# Altium schematic sheet RK3566_DDR-PHY_SHEET.SchDoc
size 420 x 297 mm; SheetNumber: 9; SheetTotal: 23
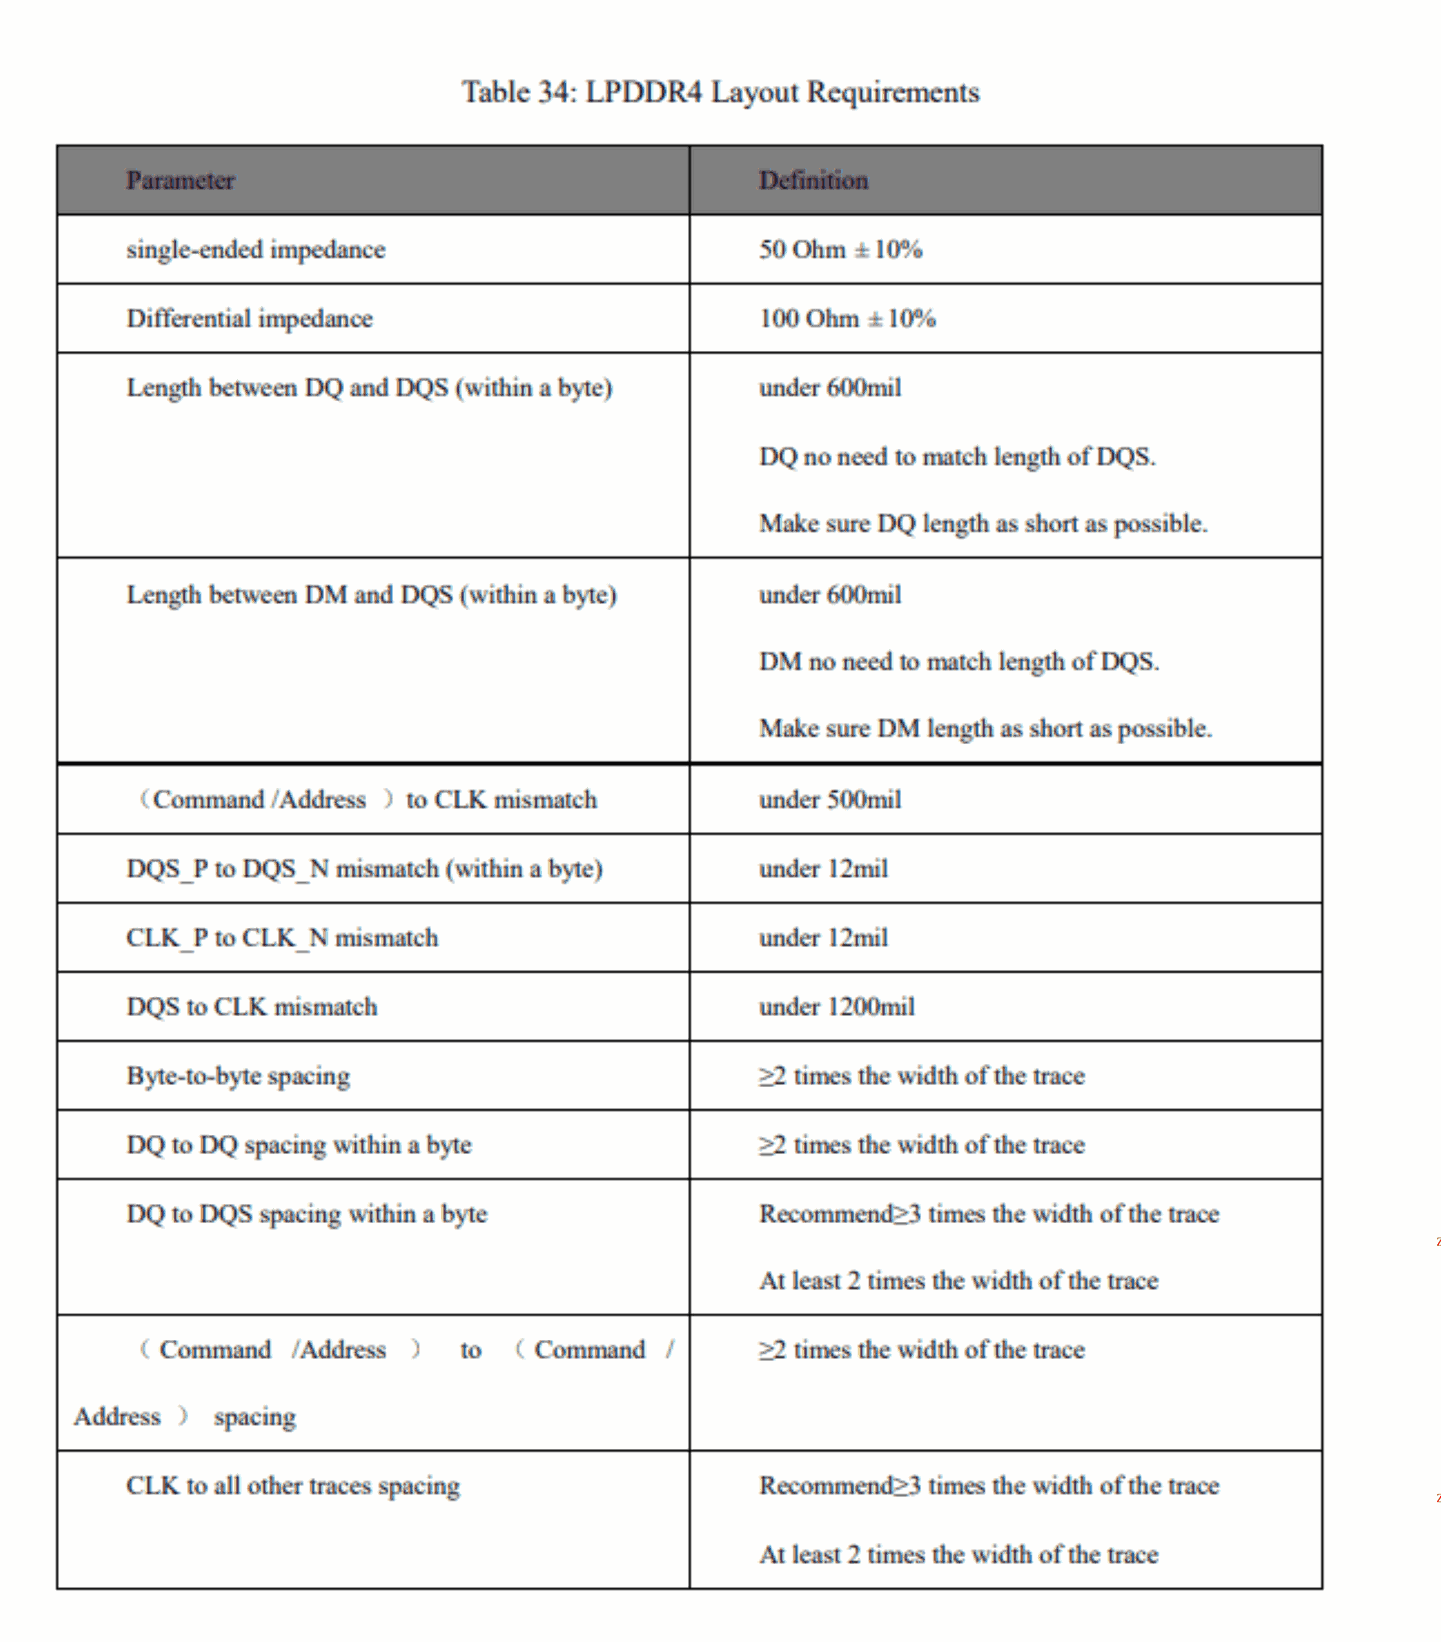
[diagram p0: RK3566_DDR-PHY_SHEET.SchDoc, left]
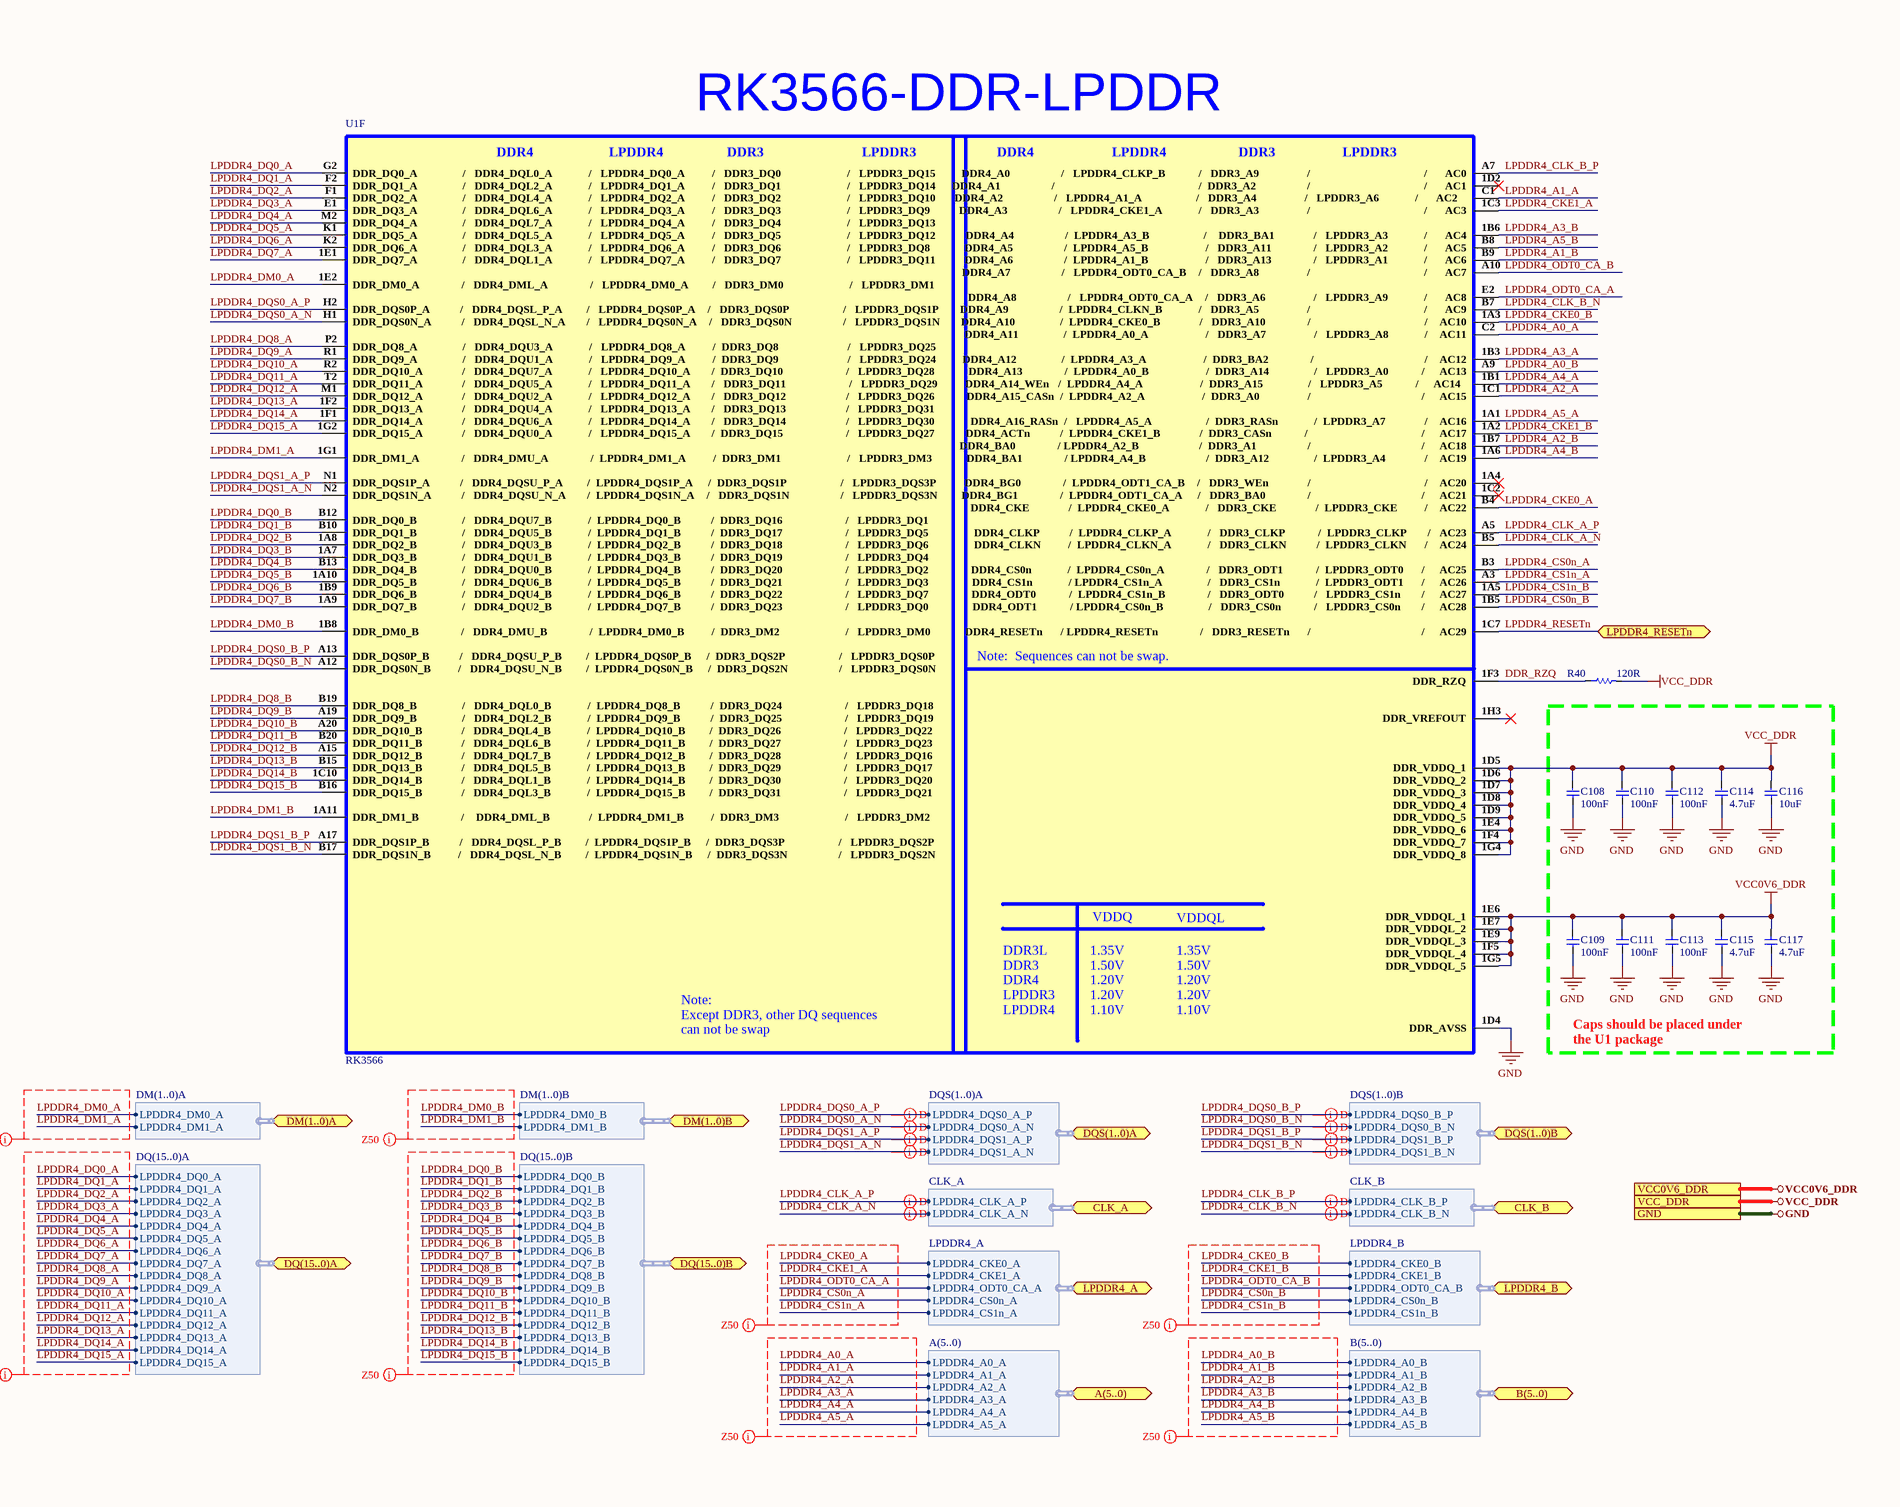
[diagram p1: RK3566_DDR-PHY_SHEET.SchDoc, right]

## Parts
C108  100nF  [CAP-0201]
C109  100nF  [CAP-0201]
C110  100nF  [CAP-0201]
C111  100nF  [CAP-0201]
C112  100nF  [CAP-0201]
C113  100nF  [CAP-0201]
C114  4.7uF  [Cap-0402]
C115  4.7uF  [Cap-0402]
C116  10uF  [Cap-0603]
C117  4.7uF  [Cap-0402]
R40  120R  [Res-0402]
U1  RK3566  [BGA-565(15.5x14.4)]  (part F of 22)

## Ports
A(5..0) (bidir, harness A(5..0), see DRAM_LPDDR4_SHEET[6B]), B(5..0) (bidir, harness B(5..0), see DRAM_LPDDR4_SHEET[6B]), CLK_A (bidir, harness CLK_A, see DRAM_LPDDR4_SHEET[5D]), CLK_B (bidir, harness CLK_B, see DRAM_LPDDR4_SHEET[5D]), DM(1..0)A (bidir, harness DM(1..0)A, see DRAM_LPDDR4_SHEET[6C]), DM(1..0)B (bidir, harness DM(1..0)B, see DRAM_LPDDR4_SHEET[6C]), DQ(15..0)A (bidir, harness DQ(15..0)A, see DRAM_LPDDR4_SHEET[6A]), DQ(15..0)B (bidir, harness DQ(15..0)B, see DRAM_LPDDR4_SHEET[6B]), DQS(1..0)A (bidir, harness DQS(1..0)A, see DRAM_LPDDR4_SHEET[5D]), DQS(1..0)B (bidir, harness DQS(1..0)B, see DRAM_LPDDR4_SHEET[5D]), GND (see DRAM_LPDDR4_SHEET[6D], eMMC_SPI-FLASH_SHEET[1D], HDMI2.0_SHEET[3D], POWER_LDO_SHEET[3D], POWER_OTHER_SHEET[3C], POWER_PMIC_RK809_CODEC[3C], POWER_PMIC_RK809_DC DC[3D], POWER_PMIC_RK809_LDO[4C], POWER_PMIC_RK809_MGM[3D], RK3566_AUDIO_SHEET[3C], RK3566_FLASH-SD_SHEET[4C], RK3566_OSC_PMUIO_SHEET[5D], RK3566_POWER_SHEET[3D], RK3566_SARADC_GPIO[3D], RK3566_USB_PCIe_SHEET[3D], RK3566_VI_SHEET[3D], RK3566_VO_SHEET_1[3C], RK3566_VO_SHEET_2[4C], TYPE-C_INTERFACE_SHEET[3D], TYPE-C_TO_MIPI-CSI_SHEET[5D], USB2.0_SHEET[3D], WIFI-6_SHEET[3D]), LPDDR4_A (bidir, harness LPDDR4_A, see DRAM_LPDDR4_SHEET[6C]), LPDDR4_B (bidir, harness LPDDR4_B, see DRAM_LPDDR4_SHEET[6C]), LPDDR4_RESETn (bidir, see DRAM_LPDDR4_SHEET[4C]), VCC0V6_DDR (see DRAM_LPDDR4_SHEET[6D]), VCC_DDR (see DRAM_LPDDR4_SHEET[6D], POWER_PMIC_RK809_DC DC[3D])

## Harnesses
DQ(15..0)A: LPDDR4_DQ0_A, LPDDR4_DQ1_A, LPDDR4_DQ2_A, LPDDR4_DQ3_A, LPDDR4_DQ4_A, LPDDR4_DQ5_A, LPDDR4_DQ6_A, LPDDR4_DQ7_A, LPDDR4_DQ8_A, LPDDR4_DQ9_A, LPDDR4_DQ10_A, LPDDR4_DQ11_A, LPDDR4_DQ12_A, LPDDR4_DQ13_A, LPDDR4_DQ14_A, LPDDR4_DQ15_A
DQ(15..0)B: LPDDR4_DQ0_B, LPDDR4_DQ1_B, LPDDR4_DQ2_B, LPDDR4_DQ3_B, LPDDR4_DQ4_B, LPDDR4_DQ5_B, LPDDR4_DQ6_B, LPDDR4_DQ7_B, LPDDR4_DQ8_B, LPDDR4_DQ9_B, LPDDR4_DQ10_B, LPDDR4_DQ11_B, LPDDR4_DQ12_B, LPDDR4_DQ13_B, LPDDR4_DQ14_B, LPDDR4_DQ15_B
DM(1..0)A: LPDDR4_DM0_A, LPDDR4_DM1_A
DM(1..0)B: LPDDR4_DM0_B, LPDDR4_DM1_B
DQS(1..0)A: LPDDR4_DQS0_A_P, LPDDR4_DQS0_A_N, LPDDR4_DQS1_A_P, LPDDR4_DQS1_A_N
DQS(1..0)B: LPDDR4_DQS0_B_P, LPDDR4_DQS0_B_N, LPDDR4_DQS1_B_P, LPDDR4_DQS1_B_N
CLK_B: LPDDR4_CLK_B_P, LPDDR4_CLK_B_N
CLK_A: LPDDR4_CLK_A_P, LPDDR4_CLK_A_N
A(5..0): LPDDR4_A3_A, LPDDR4_A5_A, LPDDR4_A1_A, LPDDR4_A0_A, LPDDR4_A2_A, LPDDR4_A4_A
B(5..0): LPDDR4_A3_B, LPDDR4_A5_B, LPDDR4_A1_B, LPDDR4_A0_B, LPDDR4_A2_B, LPDDR4_A4_B
LPDDR4_A: LPDDR4_CKE1_A, LPDDR4_ODT0_CA_A, LPDDR4_CKE0_A, LPDDR4_CS0n_A, LPDDR4_CS1n_A
LPDDR4_B: LPDDR4_ODT0_CA_B, LPDDR4_CKE0_B, LPDDR4_CKE1_B, LPDDR4_CS1n_B, LPDDR4_CS0n_B

## Nets
GND: C108.1 C109.1 C110.1 C111.1 C112.1 C113.1 C114.1 C115.1 C116.1 C117.1 U1.1D4(DDR_AVSS) ; port GND
VCC0V6_DDR: C109.2 C111.2 C113.2 C115.2 C117.2 U1.1E6(DDR_VDDQL_1) U1.1E7(DDR_VDDQL_2) U1.1E9(DDR_VDDQL_3) U1.1F5(DDR_VDDQL_4) U1.1G5(DDR_VDDQL_5) ; port VCC0V6_DDR
VCC_DDR: C108.2 C110.2 C112.2 C114.2 C116.2 R40.2 U1.1D5(DDR_VDDQ_1) U1.1D6(DDR_VDDQ_2) U1.1D7(DDR_VDDQ_3) U1.1D8(DDR_VDDQ_4) U1.1D9(DDR_VDDQ_5) U1.1E4(DDR_VDDQ_6) U1.1F4(DDR_VDDQ_7) U1.1G4(DDR_VDDQ_8) ; port VCC_DDR
DDR_RZQ: R40.1 U1.1F3(DDR_RZQ)
LPDDR4_A0_A: U1.C2(DDR4_A11_______________/__LPDDR4_A0_A___________________/___DDR3_A7________________/___LPDDR3_A8____________/____AC11) ; port A(5..0).LPDDR4_A0_A
LPDDR4_A0_B: U1.A9(DDR4_A13______________/__LPDDR4_A0_B___________________/__DDR3_A14_______________/___LPDDR3_A0___________/_____AC13) ; port B(5..0).LPDDR4_A0_B
LPDDR4_A1_A: U1.C1(DDR4_A2_________________/___LPDDR4_A1_A__________________/___DDR3_A4________________/___LPDDR3_A6____________/______AC2) ; port A(5..0).LPDDR4_A1_A
LPDDR4_A1_B: U1.B9(DDR4_A6_________________/__LPDDR4_A1_B___________________/___DDR3_A13______________/___LPDDR3_A1____________/______AC6) ; port B(5..0).LPDDR4_A1_B
LPDDR4_A2_A: U1.1C1(DDR4_A15_CASn__/__LPDDR4_A2_A___________________/__DDR3_A0________________/_____________________________________/_____AC15) ; port A(5..0).LPDDR4_A2_A
LPDDR4_A2_B: U1.1B7(DDR4_BA0______________/_LPDDR4_A2_B____________________/__DDR3_A1_________________/_____________________________________/_____AC18) ; port B(5..0).LPDDR4_A2_B
LPDDR4_A3_A: U1.1B3(DDR4_A12_______________/__LPDDR4_A3_A___________________/__DDR3_BA2______________/_____________________________________/____AC12) ; port A(5..0).LPDDR4_A3_A
LPDDR4_A3_B: U1.1B6(DDR4_A4_________________/__LPDDR4_A3_B__________________/____DDR3_BA1_____________/___LPDDR3_A3____________/______AC4) ; port B(5..0).LPDDR4_A3_B
LPDDR4_A4_A: U1.1B1(DDR4_A14_WEn___/__LPDDR4_A4_A___________________/__DDR3_A15_______________/___LPDDR3_A5___________/_____AC14) ; port A(5..0).LPDDR4_A4_A
LPDDR4_A4_B: U1.1A6(DDR4_BA1______________/_LPDDR4_A4_B____________________/__DDR3_A12_______________/__LPDDR3_A4_____________/____AC19) ; port B(5..0).LPDDR4_A4_B
LPDDR4_A5_A: U1.1A1(DDR4_A16_RASn__/___LPDDR4_A5_A__________________/__DDR3_RASn____________/__LPDDR3_A7_____________/____AC16) ; port A(5..0).LPDDR4_A5_A
LPDDR4_A5_B: U1.B8(DDR4_A5_________________/__LPDDR4_A5_B___________________/___DDR3_A11______________/___LPDDR3_A2____________/______AC5) ; port B(5..0).LPDDR4_A5_B
LPDDR4_CKE0_A: U1.B4(DDR4_CKE_____________/__LPDDR4_CKE0_A____________/___DDR3_CKE_____________/__LPDDR3_CKE_________/____AC22) ; port LPDDR4_A.LPDDR4_CKE0_A
LPDDR4_CKE0_B: U1.1A3(DDR4_A10_______________/__LPDDR4_CKE0_B_____________/___DDR3_A10______________/______________________________________/____AC10) ; port LPDDR4_B.LPDDR4_CKE0_B
LPDDR4_CKE1_A: U1.1C3(DDR4_A3_________________/___LPDDR4_CKE1_A____________/___DDR3_A3________________/______________________________________/______AC3) ; port LPDDR4_A.LPDDR4_CKE1_A
LPDDR4_CKE1_B: U1.1A2(DDR4_ACTn__________/__LPDDR4_CKE1_B_____________/__DDR3_CASn___________/______________________________________/_____AC17) ; port LPDDR4_B.LPDDR4_CKE1_B
LPDDR4_CLK_A_N: U1.B5(DDR4_CLKN_________/__LPDDR4_CLKN_A____________/___DDR3_CLKN__________/__LPDDR3_CLKN______/____AC24) ; port CLK_A.LPDDR4_CLK_A_N
LPDDR4_CLK_A_P: U1.A5(DDR4_CLKP__________/__LPDDR4_CLKP_A____________/___DDR3_CLKP___________/__LPDDR3_CLKP_______/___AC23) ; port CLK_A.LPDDR4_CLK_A_P
LPDDR4_CLK_B_N: U1.B7(DDR4_A9_________________/__LPDDR4_CLKN_B____________/___DDR3_A5________________/______________________________________/______AC9) ; port CLK_B.LPDDR4_CLK_B_N
LPDDR4_CLK_B_P: U1.A7(DDR4_A0_________________/___LPDDR4_CLKP_B___________/___DDR3_A9________________/______________________________________/______AC0) ; port CLK_B.LPDDR4_CLK_B_P
LPDDR4_CS0n_A: U1.B3(DDR4_CS0n____________/__LPDDR4_CS0n_A______________/___DDR3_ODT1___________/__LPDDR3_ODT0______/_____AC25) ; port LPDDR4_A.LPDDR4_CS0n_A
LPDDR4_CS0n_B: U1.1B5(DDR4_ODT1___________/_LPDDR4_CS0n_B_______________/___DDR3_CS0n___________/___LPDDR3_CS0n_______/_____AC28) ; port LPDDR4_B.LPDDR4_CS0n_B
LPDDR4_CS1n_A: U1.A3(DDR4_CS1n____________/_LPDDR4_CS1n_A_______________/___DDR3_CS1n____________/__LPDDR3_ODT1______/_____AC26) ; port LPDDR4_A.LPDDR4_CS1n_A
LPDDR4_CS1n_B: U1.1A5(DDR4_ODT0___________/__LPDDR4_CS1n_B______________/___DDR3_ODT0__________/___LPDDR3_CS1n_______/_____AC27) ; port LPDDR4_B.LPDDR4_CS1n_B
LPDDR4_DM0_A: U1.1E2(DDR_DM0_A______________/___DDR4_DML_A______________/___LPDDR4_DM0_A________/___DDR3_DM0______________________/___LPDDR3_DM1) ; port DM(1..0)A.LPDDR4_DM0_A
LPDDR4_DM0_B: U1.1B8(DDR_DM0_B______________/___DDR4_DMU_B______________/__LPDDR4_DM0_B_________/__DDR3_DM2______________________/___LPDDR3_DM0) ; port DM(1..0)B.LPDDR4_DM0_B
LPDDR4_DM1_A: U1.1G1(DDR_DM1_A______________/___DDR4_DMU_A______________/__LPDDR4_DM1_A_________/__DDR3_DM1______________________/___LPDDR3_DM3) ; port DM(1..0)A.LPDDR4_DM1_A
LPDDR4_DM1_B: U1.1A11(DDR_DM1_B______________/____DDR4_DML_B_____________/__LPDDR4_DM1_B_________/__DDR3_DM3______________________/___LPDDR3_DM2) ; port DM(1..0)B.LPDDR4_DM1_B
LPDDR4_DQ0_A: U1.G2(DDR_DQ0_A_______________/___DDR4_DQL0_A____________/___LPDDR4_DQ0_A_________/___DDR3_DQ0______________________/___LPDDR3_DQ15) ; port DQ(15..0)A.LPDDR4_DQ0_A
LPDDR4_DQ0_B: U1.B12(DDR_DQ0_B_______________/___DDR4_DQU7_B____________/__LPDDR4_DQ0_B__________/__DDR3_DQ16_____________________/___LPDDR3_DQ1) ; port DQ(15..0)B.LPDDR4_DQ0_B
LPDDR4_DQ1_A: U1.F2(DDR_DQ1_A_______________/___DDR4_DQL2_A____________/___LPDDR4_DQ1_A_________/___DDR3_DQ1______________________/___LPDDR3_DQ14) ; port DQ(15..0)A.LPDDR4_DQ1_A
LPDDR4_DQ1_B: U1.B10(DDR_DQ1_B_______________/___DDR4_DQU5_B____________/__LPDDR4_DQ1_B__________/__DDR3_DQ17_____________________/___LPDDR3_DQ5) ; port DQ(15..0)B.LPDDR4_DQ1_B
LPDDR4_DQ2_A: U1.F1(DDR_DQ2_A_______________/___DDR4_DQL4_A____________/___LPDDR4_DQ2_A_________/___DDR3_DQ2______________________/___LPDDR3_DQ10) ; port DQ(15..0)A.LPDDR4_DQ2_A
LPDDR4_DQ2_B: U1.1A8(DDR_DQ2_B_______________/___DDR4_DQU3_B____________/__LPDDR4_DQ2_B__________/__DDR3_DQ18_____________________/___LPDDR3_DQ6) ; port DQ(15..0)B.LPDDR4_DQ2_B
LPDDR4_DQ3_A: U1.E1(DDR_DQ3_A_______________/___DDR4_DQL6_A____________/___LPDDR4_DQ3_A_________/___DDR3_DQ3______________________/___LPDDR3_DQ9) ; port DQ(15..0)A.LPDDR4_DQ3_A
LPDDR4_DQ3_B: U1.1A7(DDR_DQ3_B_______________/___DDR4_DQU1_B____________/__LPDDR4_DQ3_B__________/__DDR3_DQ19_____________________/___LPDDR3_DQ4) ; port DQ(15..0)B.LPDDR4_DQ3_B
LPDDR4_DQ4_A: U1.M2(DDR_DQ4_A_______________/___DDR4_DQL7_A____________/___LPDDR4_DQ4_A_________/___DDR3_DQ4______________________/___LPDDR3_DQ13) ; port DQ(15..0)A.LPDDR4_DQ4_A
LPDDR4_DQ4_B: U1.B13(DDR_DQ4_B_______________/___DDR4_DQU0_B____________/__LPDDR4_DQ4_B__________/__DDR3_DQ20_____________________/___LPDDR3_DQ2) ; port DQ(15..0)B.LPDDR4_DQ4_B
LPDDR4_DQ5_A: U1.K1(DDR_DQ5_A_______________/___DDR4_DQL5_A____________/___LPDDR4_DQ5_A_________/___DDR3_DQ5______________________/___LPDDR3_DQ12) ; port DQ(15..0)A.LPDDR4_DQ5_A
LPDDR4_DQ5_B: U1.1A10(DDR_DQ5_B_______________/___DDR4_DQU6_B____________/__LPDDR4_DQ5_B__________/__DDR3_DQ21_____________________/___LPDDR3_DQ3) ; port DQ(15..0)B.LPDDR4_DQ5_B
LPDDR4_DQ6_A: U1.K2(DDR_DQ6_A_______________/___DDR4_DQL3_A____________/___LPDDR4_DQ6_A_________/___DDR3_DQ6______________________/___LPDDR3_DQ8) ; port DQ(15..0)A.LPDDR4_DQ6_A
LPDDR4_DQ6_B: U1.1B9(DDR_DQ6_B_______________/___DDR4_DQU4_B____________/__LPDDR4_DQ6_B__________/__DDR3_DQ22_____________________/___LPDDR3_DQ7) ; port DQ(15..0)B.LPDDR4_DQ6_B
LPDDR4_DQ7_A: U1.1E1(DDR_DQ7_A_______________/___DDR4_DQL1_A____________/___LPDDR4_DQ7_A_________/___DDR3_DQ7______________________/___LPDDR3_DQ11) ; port DQ(15..0)A.LPDDR4_DQ7_A
LPDDR4_DQ7_B: U1.1A9(DDR_DQ7_B_______________/___DDR4_DQU2_B____________/__LPDDR4_DQ7_B__________/__DDR3_DQ23_____________________/___LPDDR3_DQ0) ; port DQ(15..0)B.LPDDR4_DQ7_B
LPDDR4_DQ8_A: U1.P2(DDR_DQ8_A_______________/___DDR4_DQU3_A____________/___LPDDR4_DQ8_A_________/__DDR3_DQ8_______________________/___LPDDR3_DQ25) ; port DQ(15..0)A.LPDDR4_DQ8_A
LPDDR4_DQ8_B: U1.B19(DDR_DQ8_B_______________/___DDR4_DQL0_B____________/__LPDDR4_DQ8_B__________/__DDR3_DQ24_____________________/___LPDDR3_DQ18) ; port DQ(15..0)B.LPDDR4_DQ8_B
LPDDR4_DQ9_A: U1.R1(DDR_DQ9_A_______________/___DDR4_DQU1_A____________/___LPDDR4_DQ9_A_________/__DDR3_DQ9_______________________/___LPDDR3_DQ24) ; port DQ(15..0)A.LPDDR4_DQ9_A
LPDDR4_DQ9_B: U1.A19(DDR_DQ9_B_______________/___DDR4_DQL2_B____________/__LPDDR4_DQ9_B__________/__DDR3_DQ25_____________________/___LPDDR3_DQ19) ; port DQ(15..0)B.LPDDR4_DQ9_B
LPDDR4_DQ10_A: U1.R2(DDR_DQ10_A_____________/___DDR4_DQU7_A____________/___LPDDR4_DQ10_A_______/__DDR3_DQ10_____________________/___LPDDR3_DQ28) ; port DQ(15..0)A.LPDDR4_DQ10_A
LPDDR4_DQ10_B: U1.A20(DDR_DQ10_B_____________/___DDR4_DQL4_B____________/__LPDDR4_DQ10_B________/__DDR3_DQ26_____________________/___LPDDR3_DQ22) ; port DQ(15..0)B.LPDDR4_DQ10_B
LPDDR4_DQ11_A: U1.T2(DDR_DQ11_A_____________/___DDR4_DQU5_A____________/___LPDDR4_DQ11_A_______/___DDR3_DQ11_____________________/___LPDDR3_DQ29) ; port DQ(15..0)A.LPDDR4_DQ11_A
LPDDR4_DQ11_B: U1.B20(DDR_DQ11_B_____________/___DDR4_DQL6_B____________/__LPDDR4_DQ11_B________/__DDR3_DQ27_____________________/___LPDDR3_DQ23) ; port DQ(15..0)B.LPDDR4_DQ11_B
LPDDR4_DQ12_A: U1.M1(DDR_DQ12_A_____________/___DDR4_DQU2_A____________/___LPDDR4_DQ12_A_______/___DDR3_DQ12____________________/___LPDDR3_DQ26) ; port DQ(15..0)A.LPDDR4_DQ12_A
LPDDR4_DQ12_B: U1.A15(DDR_DQ12_B_____________/___DDR4_DQL7_B____________/__LPDDR4_DQ12_B________/__DDR3_DQ28_____________________/___LPDDR3_DQ16) ; port DQ(15..0)B.LPDDR4_DQ12_B
LPDDR4_DQ13_A: U1.1F2(DDR_DQ13_A_____________/___DDR4_DQU4_A____________/___LPDDR4_DQ13_A_______/___DDR3_DQ13____________________/___LPDDR3_DQ31) ; port DQ(15..0)A.LPDDR4_DQ13_A
LPDDR4_DQ13_B: U1.B15(DDR_DQ13_B_____________/___DDR4_DQL5_B____________/__LPDDR4_DQ13_B________/__DDR3_DQ29_____________________/___LPDDR3_DQ17) ; port DQ(15..0)B.LPDDR4_DQ13_B
LPDDR4_DQ14_A: U1.1F1(DDR_DQ14_A_____________/___DDR4_DQU6_A____________/___LPDDR4_DQ14_A_______/___DDR3_DQ14____________________/___LPDDR3_DQ30) ; port DQ(15..0)A.LPDDR4_DQ14_A
LPDDR4_DQ14_B: U1.1C10(DDR_DQ14_B_____________/___DDR4_DQL1_B____________/__LPDDR4_DQ14_B________/__DDR3_DQ30_____________________/___LPDDR3_DQ20) ; port DQ(15..0)B.LPDDR4_DQ14_B
LPDDR4_DQ15_A: U1.1G2(DDR_DQ15_A_____________/___DDR4_DQU0_A____________/___LPDDR4_DQ15_A_______/__DDR3_DQ15_____________________/___LPDDR3_DQ27) ; port DQ(15..0)A.LPDDR4_DQ15_A
LPDDR4_DQ15_B: U1.B16(DDR_DQ15_B_____________/___DDR4_DQL3_B____________/__LPDDR4_DQ15_B________/__DDR3_DQ31_____________________/___LPDDR3_DQ21) ; port DQ(15..0)B.LPDDR4_DQ15_B
LPDDR4_DQS0_A_N: U1.H1(DDR_DQS0N_A__________/___DDR4_DQSL_N_A_______/___LPDDR4_DQS0N_A____/___DDR3_DQS0N_________________/___LPDDR3_DQS1N) ; port DQS(1..0)A.LPDDR4_DQS0_A_N
LPDDR4_DQS0_A_P: U1.H2(DDR_DQS0P_A__________/___DDR4_DQSL_P_A________/___LPDDR4_DQS0P_A____/___DDR3_DQS0P__________________/___LPDDR3_DQS1P) ; port DQS(1..0)A.LPDDR4_DQS0_A_P
LPDDR4_DQS0_B_N: U1.A12(DDR_DQS0N_B_________/___DDR4_DQSU_N_B________/__LPDDR4_DQS0N_B_____/__DDR3_DQS2N_________________/___LPDDR3_DQS0N) ; port DQS(1..0)B.LPDDR4_DQS0_B_N
LPDDR4_DQS0_B_P: U1.A13(DDR_DQS0P_B__________/___DDR4_DQSU_P_B________/__LPDDR4_DQS0P_B_____/__DDR3_DQS2P__________________/___LPDDR3_DQS0P) ; port DQS(1..0)B.LPDDR4_DQS0_B_P
LPDDR4_DQS1_A_N: U1.N2(DDR_DQS1N_A__________/___DDR4_DQSU_N_A_______/__LPDDR4_DQS1N_A____/___DDR3_DQS1N_________________/___LPDDR3_DQS3N) ; port DQS(1..0)A.LPDDR4_DQS1_A_N
LPDDR4_DQS1_A_P: U1.N1(DDR_DQS1P_A__________/___DDR4_DQSU_P_A________/__LPDDR4_DQS1P_A_____/__DDR3_DQS1P__________________/___LPDDR3_DQS3P) ; port DQS(1..0)A.LPDDR4_DQS1_A_P
LPDDR4_DQS1_B_N: U1.B17(DDR_DQS1N_B_________/___DDR4_DQSL_N_B________/__LPDDR4_DQS1N_B_____/__DDR3_DQS3N_________________/___LPDDR3_DQS2N) ; port DQS(1..0)B.LPDDR4_DQS1_B_N
LPDDR4_DQS1_B_P: U1.A17(DDR_DQS1P_B__________/___DDR4_DQSL_P_B________/__LPDDR4_DQS1P_B_____/__DDR3_DQS3P__________________/___LPDDR3_DQS2P) ; port DQS(1..0)B.LPDDR4_DQS1_B_P
LPDDR4_ODT0_CA_A: U1.E2(DDR4_A8_________________/___LPDDR4_ODT0_CA_A____/___DDR3_A6________________/___LPDDR3_A9____________/______AC8) ; port LPDDR4_A.LPDDR4_ODT0_CA_A
LPDDR4_ODT0_CA_B: U1.A10(DDR4_A7_________________/___LPDDR4_ODT0_CA_B____/___DDR3_A8________________/______________________________________/______AC7) ; port LPDDR4_B.LPDDR4_ODT0_CA_B
LPDDR4_RESETn: U1.1C7(DDR4_RESETn______/_LPDDR4_RESETn______________/___DDR3_RESETn______/_____________________________________/_____AC29) ; port LPDDR4_RESETn

Not connected (* = marked no-connect by the designer): U1 1A4(DDR4_BG0______________/__LPDDR4_ODT1_CA_B____/___DDR3_WEn_____________/______________________________________/____AC20)* 1C2(DDR4_BG1______________/__LPDDR4_ODT1_CA_A_____/___DDR3_BA0______________/_____________________________________/_____AC21)* 1D2(DDR4_A1_________________/________________________________________________/__DDR3_A2_________________/______________________________________/______AC1)* 1H3(DDR_VREFOUT)*

## Layout directives
net class 50OHM_DDR: LPDDR4_A0_A, LPDDR4_A0_B, LPDDR4_A1_A, LPDDR4_A1_B, LPDDR4_A2_A, LPDDR4_A2_B, LPDDR4_A3_A, LPDDR4_A3_B, LPDDR4_A4_A, LPDDR4_A4_B, LPDDR4_A5_A, LPDDR4_A5_B, LPDDR4_CKE0_A, LPDDR4_CKE0_B, LPDDR4_CKE1_A, LPDDR4_CKE1_B, LPDDR4_CS0n_A, LPDDR4_CS0n_B, LPDDR4_CS1n_A, LPDDR4_CS1n_B, LPDDR4_DM0_A, LPDDR4_DM0_B, LPDDR4_DM1_A, LPDDR4_DM1_B, LPDDR4_DQ0_A, LPDDR4_DQ0_B, LPDDR4_DQ1_A, LPDDR4_DQ1_B, LPDDR4_DQ2_A, LPDDR4_DQ2_B, LPDDR4_DQ3_A, LPDDR4_DQ3_B, LPDDR4_DQ4_A, LPDDR4_DQ4_B, LPDDR4_DQ5_A, LPDDR4_DQ5_B, LPDDR4_DQ6_A, LPDDR4_DQ6_B, LPDDR4_DQ7_A, LPDDR4_DQ7_B, LPDDR4_DQ8_A, LPDDR4_DQ8_B, LPDDR4_DQ9_A, LPDDR4_DQ9_B, LPDDR4_DQ10_A, LPDDR4_DQ10_B, LPDDR4_DQ11_A, LPDDR4_DQ11_B, LPDDR4_DQ12_A, LPDDR4_DQ12_B, LPDDR4_DQ13_A, LPDDR4_DQ13_B, LPDDR4_DQ14_A, LPDDR4_DQ14_B, LPDDR4_DQ15_A, LPDDR4_DQ15_B, LPDDR4_ODT0_CA_A, LPDDR4_ODT0_CA_B
differential pair; differential pair class 100OHM_DDR_DQS: LPDDR4_DQS0_A_N, LPDDR4_DQS0_A_P, LPDDR4_DQS0_B_N, LPDDR4_DQS0_B_P, LPDDR4_DQS1_A_N, LPDDR4_DQS1_A_P, LPDDR4_DQS1_B_N, LPDDR4_DQS1_B_P
differential pair; differential pair class 100OHM_DDR_CLK: LPDDR4_CLK_A_N, LPDDR4_CLK_A_P, LPDDR4_CLK_B_N, LPDDR4_CLK_B_P

## Notes on the sheet
- RK3566-DDR-LPDDR
- Caps should be placed under the U1 package
- File:
- Title:
- Date:
- Page
- Num:
- Total:
- Drawn By: Huzaifa Ali
- (in symbol RK3566, part F) DDR4; LPDDR4; DDR3; LPDDR3; Note:  Sequences can not be swap.; VDDQ /; VDDQL /; 1.35V / 1.50V / 1.20V / 1.20V / 1.10V; DDR3L / DDR3 / DDR4 / LPDDR3 / LPDDR4 / LPDDR4x /; 1.35V / 1.50V / 1.20V / 1.20V / 1.10V / 1.10V; 0.60V; Note: / Except DDR3, other DQ sequences / can not be swap

## Library data of the parts
C108-C113 = CC0201KRX5R6BB104: CAP CER 0.1UF 10V X5R 0201; Manufacturer: Yageo; Tolerance: 10%; Supplier 1: Mouser; Manufacturer Part Number: CC0201KRX5R6BB104; RoHS: Yes; Category: Ceramic Capacitors; Stock 1: 824403; Pricing 1: 1=0.10000, 10=0.02400, 50=0.02400, 100=0.01900, 1000=0.01100, 10000=0.00900 (USD); Mount: Surface Mount; Case/Package: 0201; Case Code (Imperial): 0201; Case Code (Metric): 0603; Weight: 6E-06oz; Min Operating Temperature: -55°C; Max Operating Temperature: 85°C; Capacitance: 100nF; Dielectric: X5R; Voltage Rating (DC): 10V; Packaging: Tape and Reel; Termination: SMD/SMT; Resistor Type: Ceramic; Voltage Rating: 10V; Series: CC; Construction: Flat; Length: 0.6mm; Width: 0.012inch; Height: 0.3mm; Thickness: 0.013inch; Depth: 0.3mm; Radiation Hardening: No; Lead Free: Lead Free; Halogen Free: Halogen Free; RoHS Compliant: Yes; ComponentLink1URL: https://datasheet.ciiva.com/11587/upy-gphc-x5r-4v-to-50v-12-11587190.pdf?src-supplier=Avnet; ComponentLink1Description: https://datasheet.ciiva.com/11587/upy-gphc-x5r-4v-to-50v-12-11587190.pdf?src-supplier=Avnet; Supplier Part Number 1: 603-CC201KRX5R6BB104; LCSC Part Number: C190183
C114 C115 C117 = CC0402KRX5R6BB475: CAP CER 4.7UF 10V X5R 0402; Manufacturer: Yageo; Tolerance: 10%; Supplier 1: Farnell; Manufacturer Part Number: CC0402KRX5R6BB475; RoHS: Yes; Category: Ceramic Capacitors; Stock 1: 20000; Pricing 1: 10000=0.02310, 50000=0.02100 (GBP); Case/Package: 0402; Capacitance: 4.7uF; RoHS Compliant: Yes; ComponentLink1URL: http://www.yageo.com/documents/recent/UPY-GPHC_X5R_4V-to-50V_25.pdf?src-supplier=Digi-Key; ComponentLink1Description: http://www.yageo.com/documents/recent/UPY-GPHC_X5R_4V-to-50V_25.pdf?src-supplier=Digi-Key; LCSC Part Number: C326586; Supplier Part Number 1: 3871698; Mount: Surface Mount; Case Code (Imperial): 0402; Case Code (Metric): 1005; Min Operating Temperature: -55°C; Max Operating Temperature: 85°C; Packaging: Cut Tape; Voltage Rating: 10V
C116 = CC0603KRX5R6BB106: CAP CER 10UF 10V X5R 0603; Manufacturer: Yageo; Tolerance: 10%; Item Type: Capacitor; Supplier 1: Digi-Key; Manufacturer Part Number: CC0603KRX5R6BB106; RoHS: Yes; Category: Ceramic Capacitors; Stock 1: 187515; Pricing 1: 1=0.24000, 10=0.16300, 50=0.09780, 100=0.08260, 500=0.05654, 1000=0.05001 (USD); Mount: Surface Mount; Case/Package: 0603; Case Code (Metric): 1608; Case Code (Imperial): 0603; Min Operating Temperature: -55°C; Max Operating Temperature: 85°C; Capacitance: 10uF; Dielectric: X5R; Packaging: Tape and Reel; Package Quantity: 4000; Voltage Rating: 10V; Termination: SMD/SMT; Length: 0.063inch; Width: 0.031inch; Thickness: 0.035inch; Depth: 0.8mm; Lead Free: Lead Free; RoHS Compliant: Yes; ComponentLink1URL: http://www.mouser.com/ds/2/447/Yageo_UPY-GP_NP0_16V-to-50V_9-358835.pdf?src-supplier=Mouser; ComponentLink1Description: http://www.mouser.com/ds/2/447/Yageo_UPY-GP_NP0_16V-to-50V_9-358835.pdf?src-supplier=Mouser; ComponentLink2URL: http://www.yageo.com/documents/recent/UPY-GPHC_X5R_4V-to-50V_25.pdf?src-supplier=Digi-Key; ComponentLink2Description: http://www.yageo.com/documents/recent/UPY-GPHC_X5R_4V-to-50V_25.pdf?src-supplier=Digi-Key; Supplier Part Number 1: 311-1782-1-ND; LCSC Part Number: C326057; Weight: 7.1E-05oz; Resistor Type: Ceramic; Voltage Rating (DC): 10V; Halogen Free: Halogen Free
R40 = RC0402FR-07120RL: RES 120 OHM 1% 1/16W 0402; Manufacturer: Yageo; Item Type: Resistors; Power Rating: 62.5mW; Voltage Rating: 50V; Temperature Coefficient: 100ppm/°C; Max Power Dissipation: 63mW; Manufacturer Part Number: RC0402FR-07120RL; RoHS: Yes; Lead Free: 5697LeadFree; ComponentLink1URL: https://datasheet.ciiva.com/12667/pyu-rc0402-51-rohs-l-6-r-12667958.pdf?src-supplier=Mouser; ComponentLink1Description: https://datasheet.ciiva.com/12667/pyu-rc0402-51-rohs-l-6-r-12667958.pdf?src-supplier=Mouser; ComponentLink2URL: https://datasheet.ciiva.com/7849/1018594-7849831.pdf?src-supplier=Element14; ComponentLink2Description: https://datasheet.ciiva.com/7849/1018594-7849831.pdf?src-supplier=Element14; LCSC Part Number: C114758; Supplier: Future Electronics; Supplier Part Number: 4529079; Stock: 150000; Pricing: 10000=0.0012, 100000=0.0011, 300000=0.001, 750000=0.001, 2000000=0.0009 (USD); Case/Package: 0402; Case Code (Imperial): 0402; Case Code (Metric): 1005; Min Operating Temperature: -55°C; Max Operating Temperature: 155°C; Package Quantity: 1; Value: 120R; Tolerance: 1%; Packaging: Tape and Reel; Termination: SMD/SMT; Resistor Type: Thick Film; Number of Terminations: 2; Features: Moisture Resistant; Series: RC; Resistance Tolerance: 1%; Construction: Rectangular; Technology: THICK FILM; Voltage Rating (AC): 50V; Length: 0.039inch; Width: 0.02inch; Height: 0.016inch; Depth: 0.5mm; Reach SVHC Compliant: No; Military Standard: Not; RoHS Compliant: Yes
U1 = RK3566: BGA-565(15.5x14.4) Microcontrollers (MCU/MPU/SOC) ROHS; Manufacturer: Rockchip; Item Type: IC; Manufacturer Part Number: RK3566; Package: BGA-565(15.5x14.4); LCSC Part Number: C2943786; ComponentLink1Description: LCSC; ComponentLink1URL: https://www.lcsc.com/product-detail/Microcontrollers-MCU-MPU-SOC_Rockchip-RK3566_C2943786.html